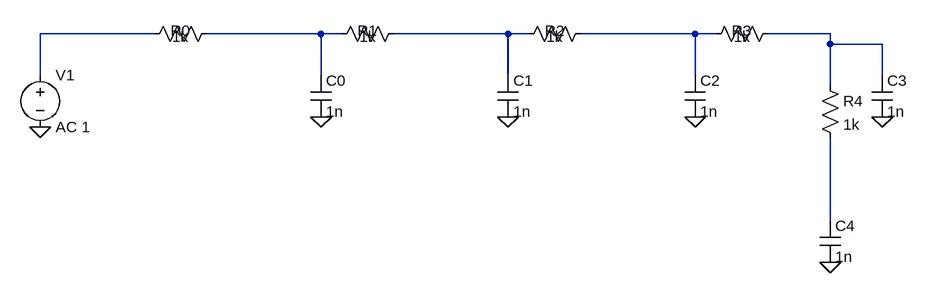
[diagram p0: schematic unseen_ladder5.asc]
unseen_ladder5.asc, the LTspice schematic file:
Version 4.1
SHEET 1 1600 1200
WIRE 1152 288 1152 160
WIRE 112 0 -64 0
WIRE -64 0 -64 64
WIRE 1152 80 1152 16
WIRE 1152 16 1152 0
WIRE 1152 0 1056 0
WIRE 1232 64 1232 16
WIRE 1232 16 1152 16
WIRE 400 0 368 0
WIRE 368 0 192 0
WIRE 368 64 368 0
WIRE 688 0 656 0
WIRE 656 0 480 0
WIRE 656 64 656 0
WIRE 976 0 944 0
WIRE 944 0 768 0
WIRE 944 64 944 0
FLAG -64 144 0
FLAG 368 128 0
FLAG 656 128 0
FLAG 944 128 0
FLAG 1232 128 0
FLAG 1152 352 0
SYMBOL res 96 16 R270
WINDOW 0 36 56 VBottom 2
WINDOW 3 -4 56 VTop 2
SYMATTR InstName R0
SYMATTR Value 1k
SYMBOL res 384 16 R270
WINDOW 0 36 56 VBottom 2
WINDOW 3 -4 56 VTop 2
SYMATTR InstName R1
SYMATTR Value 1k
SYMBOL res 672 16 R270
WINDOW 0 36 56 VBottom 2
WINDOW 3 -4 56 VTop 2
SYMATTR InstName R2
SYMATTR Value 1k
SYMBOL res 960 16 R270
WINDOW 0 36 56 VBottom 2
WINDOW 3 -4 56 VTop 2
SYMATTR InstName R3
SYMATTR Value 1k
SYMBOL res 1136 64 R0
SYMATTR InstName R4
SYMATTR Value 1k
SYMBOL cap 352 64 R0
SYMATTR InstName C0
SYMATTR Value 1n
SYMBOL cap 640 64 R0
SYMATTR InstName C1
SYMATTR Value 1n
SYMBOL cap 928 64 R0
SYMATTR InstName C2
SYMATTR Value 1n
SYMBOL cap 1216 64 R0
SYMATTR InstName C3
SYMATTR Value 1n
SYMBOL cap 1136 288 R0
SYMATTR InstName C4
SYMATTR Value 1n
SYMBOL voltage -64 48 R0
SYMATTR InstName V1
SYMATTR Value AC 1

The netlist it stands for:
* unseen_ladder5.asc
R0 N002 N004 1k
R1 N004 N005 1k
R2 N005 N006 1k
R3 N006 N003 1k
R4 N003 N001 1k
C0 N004 0 1n
C1 N005 0 1n
C2 N006 0 1n
C3 N003 0 1n
C4 N001 0 1n
V1 N002 0 AC 1
.backanno
.end